# EasyEDA Pro project ProPrj_BondTest72_MCP4725_ADC_add-on_r1_20-809DE.epro

# Schematic Schematic1
Board Name: Board1; Create Date: 2026-10-23; Page Name: P1; Project Name: BondTest72 MCP4725 ADC add-on r1; Schematic Name: Schematic1; Update Date: 2026-10-23; Company: EasyEDA.com; Page Size: A4; Version: V1.0
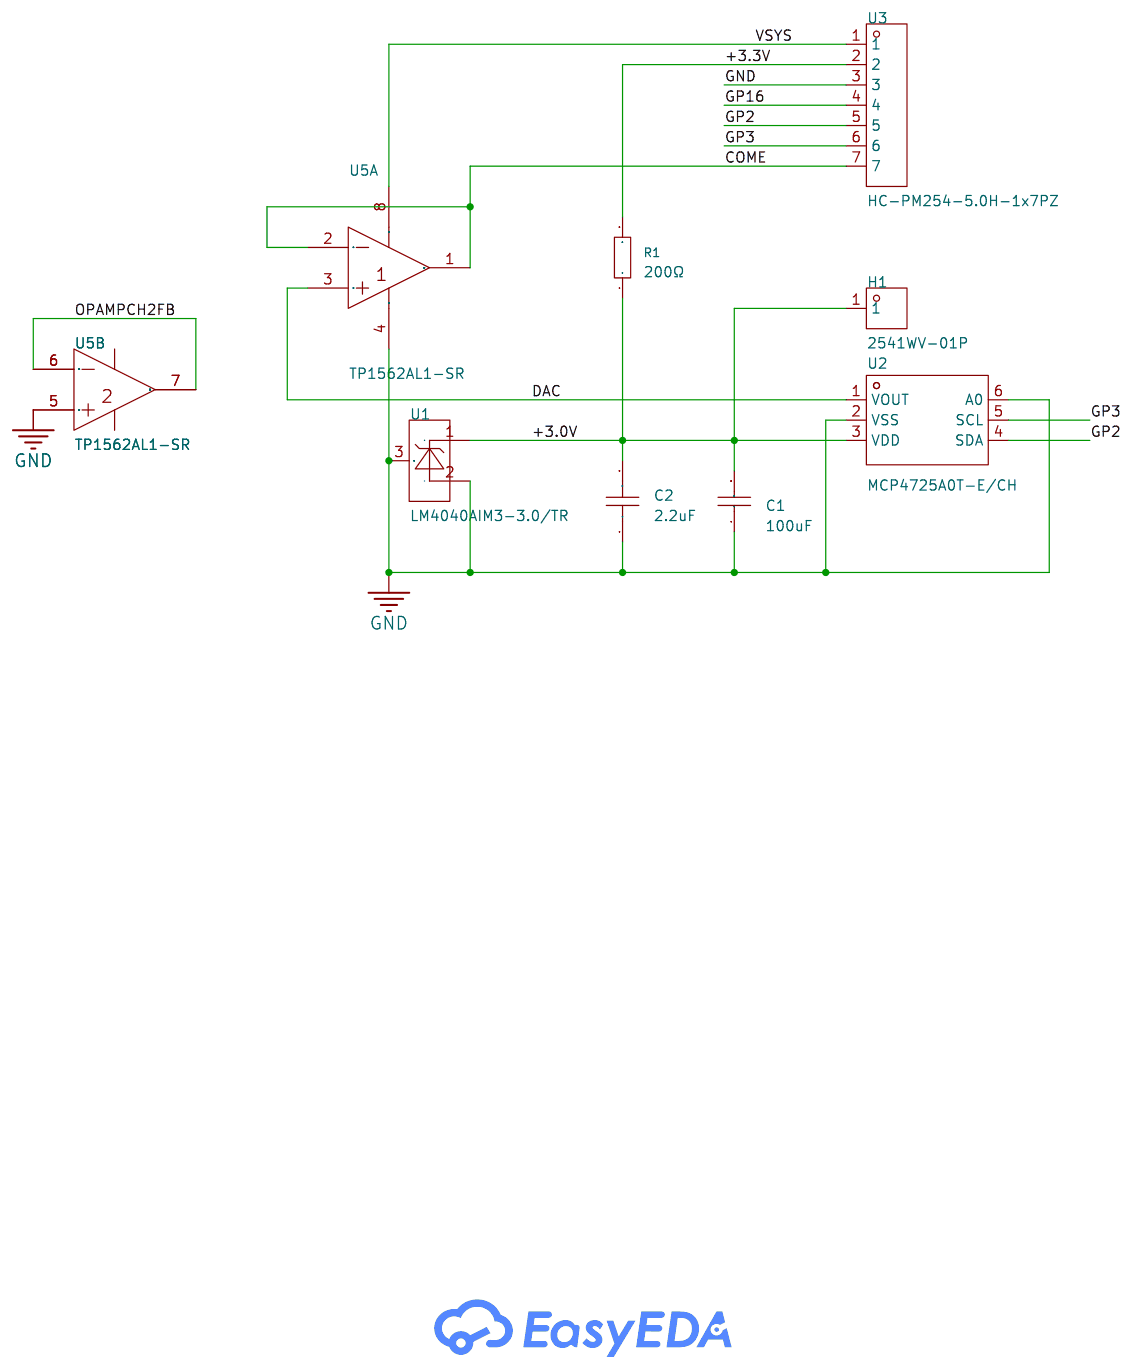
[diagram p0: schematic sheet]

## Parts
C1  100uF  [C1206]
C2  2.2uF  [C0402]
H1  2541WV-01P  [HDR-TH_1P-P2.54-V-F]  (no BOM)
R1  200Ω  [R0402]
U1  LM4040AIM3-3.0/TR  [SOT-23-3_L2.9-W1.3-P1.90-LS2.4-BR]
U2  MCP4725A0T-E/CH  [SOT-23-6_L2.9-W1.6-P0.95-LS2.8-BL]
U3  HC-PM254-5.0H-1x7PZ  [HDR-TH_7P-P2.54-V-M-3]
U5  TP1562AL1-SR  [SOIC-8_L4.9-W3.9-P1.27-LS6.0-BL]  (sections 1,2)

## Library data of the parts
C1 = CL31A107MQHNNNE: Capacitance:100uF Tolerance:±20% Tolerance:±20% Voltage Rating:6.3V Temperature Coefficient:X5R; LCSC Part Name: 100uF ±20% 6.3V; Supplier Part: C15008; Manufacturer: SAMSUNG(三星); Supplier Footprint: 1206; JLCPCB Part Class: Basic Part; Datasheet: https://item.szlcsc.com/datasheet/CL31A107MQHNNNE/15681.html; Supplier: LCSC; Tolerance: ±20%; Voltage Rating: 6.3V; Temperature Coefficient: X5R
C2 = CL05A225MQ5NSNC: Capacitance:2.2uF Tolerance:±20% Tolerance:±20% Voltage Rating:6.3V Temperature Coefficient:X5R; LCSC Part Name: 2.2uF ±20% 6.3V; Supplier Part: C12530; Manufacturer: SAMSUNG(三星); Supplier Footprint: 0402; JLCPCB Part Class: Basic Part; Datasheet: https://item.szlcsc.com/datasheet/CL05A225MQ5NSNC/13164.html; Supplier: LCSC; Tolerance: ±20%; Voltage Rating: 6.3V; Temperature Coefficient: X5R
H1 = 2541WV-01P: Pin Structure:1x1P Pitch:2.54mm Row Spacing:- Circluar Pins/Square Pins:Pin Header Mounting Type:Through Hole Number of Rows:1 Number of Pins:1P Current Rating:3A Length of Mating Pin:6mm Insulation Height:2.54mm Length of End Connection Pin:3mm Contact M; LCSC Part Name: 1x1P 间距:2.54mm 方针 直插; Supplier Part: C25503131; Manufacturer: HanElectricity(瀚源); Supplier Footprint: 插件,P=2.54mm; JLCPCB Part Class: Extended Part; Datasheet: https://item.szlcsc.com/datasheet/2541WV-01P/27233674.html; Supplier: LCSC; Pin Structure: 1x1P; Pitch: 2.54mm; Circluar Pins/Square Pins: Pin Header; Mounting Type: Through Hole; Number of Rows: 1; Number of Pins: 1P; Current Rating: 3A; Length of Mating Pin: 6mm; Insulation Height: 2.54mm; Length of End Connection Pin: 3mm; Contact Material: Brass; Contact Plating: Gold; Operating Temperature: -55℃~+105℃
R1 = 0402WGF2000TCE: Type:Thick Film Resistor Resistance:200Ω Tolerance:±1% Tolerance:±1% Power(Watts):62.5mW Voltage-Supply(Max):50V Temperature Coefficient:±100ppm/℃ Temperature Coefficient:±100ppm/℃ Operating Temperature:-55℃~+155℃ Operating Temperature:-55℃~+155℃; LCSC Part Name: 厚膜电阻 200Ω ±1%; Supplier Part: C25087; Manufacturer: UNI-ROYAL(厚声); Supplier Footprint: 0402; JLCPCB Part Class: Basic Part; Datasheet: https://item.szlcsc.com/datasheet/0402WGF2000TCE/25830.html; Supplier: LCSC; Type: Thick Film Resistor; Tolerance: ±1%; Power(Watts): 62.5mW; Voltage-Supply(Max): 50V; Temperature Coefficient: ±100ppm/℃; Operating Temperature: -55℃~+155℃
U1 = LM4040AIM3-3.0/TR: Output Type:Fixed Voltage - Supply:- Voltage - Supply:- Output Voltage:3V Output Voltage:3V Output Current:15mA Tolerance:±0.1% Tolerance:±0.1% Temperature Coefficient:100ppm/℃ Reference Type:Parallel Quiescent Current:- Minimum Cathode Current for Regula; LCSC Part Name: 并联 100ppm/℃; Supplier Part: C42370283; Manufacturer: HGSEMI(华冠); Supplier Footprint: SOT-23; JLCPCB Part Class: Extended Part; Datasheet: https://item.szlcsc.com/datasheet/LM4040AIM3-3.0%252FTR/44243468.html; Supplier: LCSC; Output Type: Fixed; Output Voltage: 3V; Output Current: 15mA; Tolerance: ±0.1%; Temperature Coefficient: 100ppm/℃; Reference Type: Parallel; Minimum Cathode Current for Regulation: 45uA; Noise - 10Hz to 10kHz: 45uVrms; Operating Temperature: -40℃~+85℃
U2 = MCP4725A0T-E/CH: Resolution (Bits):12 Number of Channels:1 Interface:I2C Voltage - Supply:2.7V~5.5V Voltage - Supply:2.7V~5.5V Settling Time:6us Output Type:Voltage Buffer Integral non - linearity:2LSB Integral non - linearity:2LSB Operating Temperature:-40℃~+125℃ Operati; LCSC Part Name: 12位带EEPROM存储器的数模转换器; Supplier Part: C144198; Manufacturer: MICROCHIP(美国微芯); Supplier Footprint: SOT-23-6; JLCPCB Part Class: Extended Part; Datasheet: https://item.szlcsc.com/datasheet/MCP4725A0T-E%252FCH/155530.html; Supplier: LCSC; Resolution (Bits): 12; Number of Channels: 1; Interface: I2C; Voltage - Supply: 2.7V~5.5V; Settling Time: 6us; Output Type: Voltage Buffer; Integral non - linearity: 2LSB; Operating Temperature: -40℃~+125℃; Function: Integrated buffer；Power-down mode；Power-on reset; Quiescent Current (Iq): 210uA
U3 = HC-PM254-5.0H-1x7PZ: Holes Structure:1x7P Pitch:2.54mm Row Spacing:- Circular Hole / Square Hole:Square Hole Mounting Type:Through Hole Number of Rows:1 Number of Positions:7P Current Rating:3A Voltage Rating (Max):- Holes Direction:Top Insulation Height:5mm Contact Material:; LCSC Part Name: 间距2.54mm 1x7Pin 直插 PC3.0 H5.0; Supplier Part: C27985232; Manufacturer: HC(虹成电子); Supplier Footprint: 插件,P=2.54mm; JLCPCB Part Class: Extended Part; Datasheet: https://item.szlcsc.com/datasheet/HC-PM254-5.0H-1x7PZ/29721190.html; Supplier: LCSC; Holes Structure: 1x7P; Pitch: 2.54mm; Circular Hole / Square Hole: Square Hole; Mounting Type: Through Hole; Number of Rows: 1; Number of Positions: 7P; Current Rating: 3A; Holes Direction: Top; Insulation Height: 5mm; Contact Material: Brass; Contact Plating: Gold; Operating Temperature: -40℃~+105℃; PIN Length: 3mm
U5 = TP1562AL1-SR: Number of Channels:2 Rail to Rail:Rail-to-Rail Input, Rail-to-Rail Output Gain Bandwidth Product:6MHz Vos - Input Offset Voltage:3mV Input Offset Voltage Drift(Vos TC):1uV/℃ Slew Rate:4.5V/us Ib - Input Bias Current:1pA Input Offset Current(Ios):1pA Input; LCSC Part Name: 6MHz、600μA、轨到轨输入输出运算放大器; Supplier Part: C248727; Manufacturer: 3PEAK(思瑞浦); Supplier Footprint: SOIC-8; JLCPCB Part Class: Extended Part; Datasheet: https://item.szlcsc.com/datasheet/TP1562AL1-SR/245296.html; Supplier: LCSC; Number of Channels: 2; Rail to Rail: Rail-to-Rail Input, Rail-to-Rail Output; Gain Bandwidth Product: 6MHz; Vos - Input Offset Voltage: 3mV; Input Offset Voltage Drift(Vos TC): 1uV/℃; Slew Rate: 4.5V/us; Ib - Input Bias Current: 1pA; Input Offset Current(Ios): 1pA; Input Voltage Noise Density: 19nV/√Hz@1kHz; Common Mode Rejection Ratio(CMRR): 100dB; Quiescent Current: 600uA; Output Current: 100mA; Operating Temperature: -40℃~+125℃; Single supply: 2.5V~6V

## Nets
+3.0V: C1.2 C2.2 H1.1 R1.1 U1.1(+) U2.3(VDD)
+3.3V: R1.2 U3.2
GND: C1.1 C2.1 U1.2(-) U1.3 U2.2(VSS) U2.6(A0) U3.3 U5.4(-VS) U5.5(INB+)
COME: U3.7 U5.1(OUTA) U5.2(INA-)
DAC: U2.1(VOUT) U5.3(INA+)
GP2: U2.4(SDA) U3.5
GP3: U2.5(SCL) U3.6
GP16: U3.4
OPAMPCH2FB: U5.6(INB-) U5.7(OUTB)
VSYS: U3.1 U5.8(+VS)

# Board PCB1
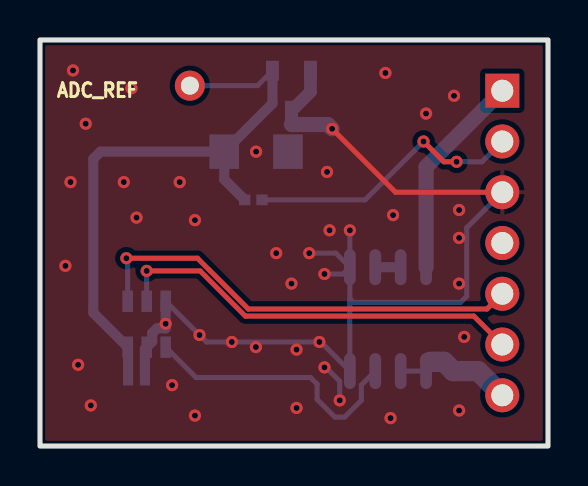
[diagram p1: board, top side]
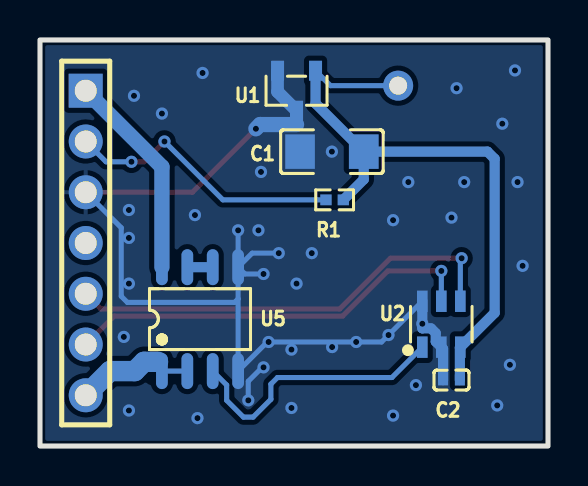
[diagram p2: board, bottom side, seen from below]

Outline 25.4 x 20.32 mm; copper layers: Top Layer, Bottom Layer. Coordinates in mm from the lower left corner of the outline.
Outline path: rectangle 0,20.32 25.4,0
Stack: Top Layer 0.035mm / Dielectric1 1.51mm FR4 er 4.5 / Bottom Layer 0.035mm

## Design rules (mm)
net GND: Power
net COME: MediumWide
net +3.3V: MediumWide
net VSYS: Power
net +3.0V: Power
net DAC: MediumWide
net OPAMPCH2FB: MediumWide
template: Custom Config
spacing copperThickness1oz (default): track to track 0.102, other pairs 0.152 to 0.3
spacing copperThickness2oz: track to track 0.203, other pairs 0.152 to 0.3
track width copperThickness1oz (default): min 0.127, default 0.254, max 2.54
track width copperThickness2oz: min 0.203, default 0.254, max 2.54
differential pair differentialPair (default): width min 0.127, default 0.254, max 2.54; gap min 0.152, default 0.152
via viaSize (default): diameter min 0.5, default 0.61, max 10; hole min 0.3, default 0.305, max 6.3

## Placement (name value [footprint] x y rotation side)
ADC_REF  -  [HDR-TH_1P-P2.54-V-F]  7.49 18.03 0 top
C1  100uF  [C1206]  10.81 14.73 180 bottom
C2  2.2uF  [C0402]  4.83 3.3 180 bottom
R1  200Ω  [R0402]  10.67 12.32 0 bottom
U1  LM4040AIM3-3.0/TR  [SOT-23-3_L2.9-W1.3-P1.90-LS2.4-BR]  12.57 17.78 90 bottom
U2  MCP4725A0T-E/CH  [SOT-23-6_L2.9-W1.6-P0.95-LS2.8-BL]  5.33 6.1 180 bottom
U3  HC-PM254-5.0H-1x7PZ  [HDR-TH_7P-P2.54-V-M-3]  23.11 10.16 270 bottom
U5  TP1562AL1-SR  [SOIC-8_L4.9-W3.9-P1.27-LS6.0-BL]  17.4 6.35 180 bottom

## Footprints (pads in the part's own frame, mm; a bottom-side part is the same pattern mirrored in y, then rotated)
C0402
  rect 0.5x0.54 smd: 1(-0.42,0) 2(0.42,0)
C1206
  rect 1.485x1.728 smd: 1(-1.593,0) 2(1.593,0)
HDR-TH_1P-P2.54-V-F
  round 1.5 hole 0.9: 1(0,0)
HDR-TH_7P-P2.54-V-M-3
  rect 1.7x1.7 hole 1.1: 1(-7.62,0)
  round 1.7 hole 1.1: 2(-5.08,0) 3(-2.54,0) 4(0,0) 5(2.54,0) 6(5.08,0) 7(7.62,0)
R0402
  rect 0.566x0.54 smd: 1(-0.433,0) 2(0.433,0)
SOIC-8_L4.9-W3.9-P1.27-LS6.0-BL
  oval 0.588x1.8 smd: 1(-1.905,-2.6) 2(-0.635,-2.6) 3(0.635,-2.6) 4(1.905,-2.6) 5(1.905,2.6) 6(0.635,2.6) 7(-0.635,2.6) 8(-1.905,2.6)
SOT-23-3_L2.9-W1.3-P1.90-LS2.4-BR
  rect 1x0.65 smd: 1(1,-0.95) 2(1,0.95) 3(-1,0)
SOT-23-6_L2.9-W1.6-P0.95-LS2.8-BL
  rect 0.532x1.072 smd: 1(-0.95,-1.149) 2(0,-1.149) 3(0.95,-1.149) 4(0.95,1.149) 5(0,1.149) 6(-0.95,1.149)

## Nets
As in the schematic, except:
+3.0V: ADC_REF.1 C1.2 C2.2 R1.1 U1.1 U2.3

## Via types
v1: diameter 0.61, hole 0.305, Top Layer to Bottom Layer, 45 vias

## Routing (per net, layer and track width the routed paths; a pad name or vN(x,y) marks a point on that pad's centre or on a via; arc(x,y) is an arc through that point)
+3.0V: length 30.8
  Bottom Layer w0.254: ADC_REF.1 10.88,18.03 U1.1
  Bottom Layer w0.508: U1.1 11.62,17.14 C1.2 ; C1.2 9.21,13.34 R1.1 ; C1.2 3.03,14.73 2.67,14.37 2.67,6.66 U2.3 4.41,4.92 C2.2
+3.3V: length 14.1
  Top Layer w0.254: v1(19.18,15.24) 20.19,14.22 v1(20.83,14.22)
  Bottom Layer w0.254: U3.2 22.1,14.22 v1(20.83,14.22) ; R1.2 16.26,12.32 v1(19.18,15.24)
GND: length 55.1
  Top Layer w0.254: v1(14.6,15.88) 17.78,12.7 U3.3
  Bottom Layer w0.254: U5.5 15.49,7.37 ; U5.5 14.79,9.65 v1(13.46,9.65) ; U5.5 v1(15.49,10.79) ; U5.5 15.15,8.61 v1(14.22,8.61) ; 15.49,7.37 15.67,7.19 21.03,7.19 21.34,7.49 21.34,10.92 U3.3 ; 15.49,7.37 U5.4 14.04,5.21 v1(13.97,5.21) v1(9.59,5.21) 8.32,5.21 v1(7.97,5.55) U2.6 ; v1(14.99,2.29) 14.99,3.24 14.29,3.94 v1(14.22,3.94)
  Bottom Layer w0.508: C2.1 5.25,4.86 U2.2 5.61,5.22 5.61,5.65 5.85,5.89 6.28,5.89 6.28,5.9 U2.6
  Bottom Layer w0.635: U1.2 13.52,17.73 U1.3 12.57,16.09
  Bottom Layer w0.762: 12.57,16.09 14.39,16.09 v1(14.6,15.88)
  vias: v1(1.27,9.02) v1(1.52,13.21) v1(1.65,18.8) v1(1.91,4.06) v1(2.29,16.13) v1(2.54,2.03) v1(4.19,13.21) v1(4.57,17.91) v1(4.83,11.43) v1(6.28,6.12) v1(6.6,3.05) v1(6.99,13.21) v1(7.75,11.3) v1(7.75,1.52) v1(10.81,14.73) v1(10.79,4.95) v1(11.81,9.65) v1(12.57,8.13) v1(12.83,4.83) v1(12.83,1.9) v1(14.35,13.72) v1(14.48,10.79) v1(17.27,18.67) v1(17.53,1.4) v1(17.65,11.56) v1(19.3,16.64) v1(20.7,17.53) v1(20.96,11.81) v1(20.96,10.41) v1(20.96,8.13) v1(20.96,1.78) v1(21.21,5.46)
COME: length 5.3
  Bottom Layer w0.254: 19.04,3.75 U5.2
  Bottom Layer w1.016: U3.7 21.9,3.75 20.66,3.75 20.2,4.21 19.5,4.21
DAC: length 13.8
  Bottom Layer w0.254: U5.3 16.07,3.05 16.07,2.29 15.23,1.45 14.74,1.45 13.85,2.34 13.85,3.1 13.53,3.43 7.8,3.43 U2.1
GP2: length 22.3
  Top Layer w0.254: U3.5 22.35,6.86 10.41,6.86 7.87,9.4 v1(4.32,9.4)
  Bottom Layer w0.254: U2.4 4.38,9.33 v1(4.32,9.4)
GP3: length 20.8
  Top Layer w0.254: U3.6 21.69,6.5 10.27,6.5 8.01,8.76 v1(5.33,8.76)
  Bottom Layer w0.254: U2.5 v1(5.33,8.76)
OPAMPCH2FB: length 1.3
  Bottom Layer w0.508: U5.6 U5.7
VSYS: length 10.4
  Bottom Layer w0.762: U5.8 19.3,13.97 U3.1

## Copper pours and planes (outline as drawn; the poured copper is in the pictures)
GND on Top Layer: 0,20.32 25.4,20.32 25.4,0 0,0
GND on Bottom Layer: 0,20.32 25.4,20.32 25.4,0 0,0
